# Altium project PGS-System.PrjPcb (part 1 of 16)
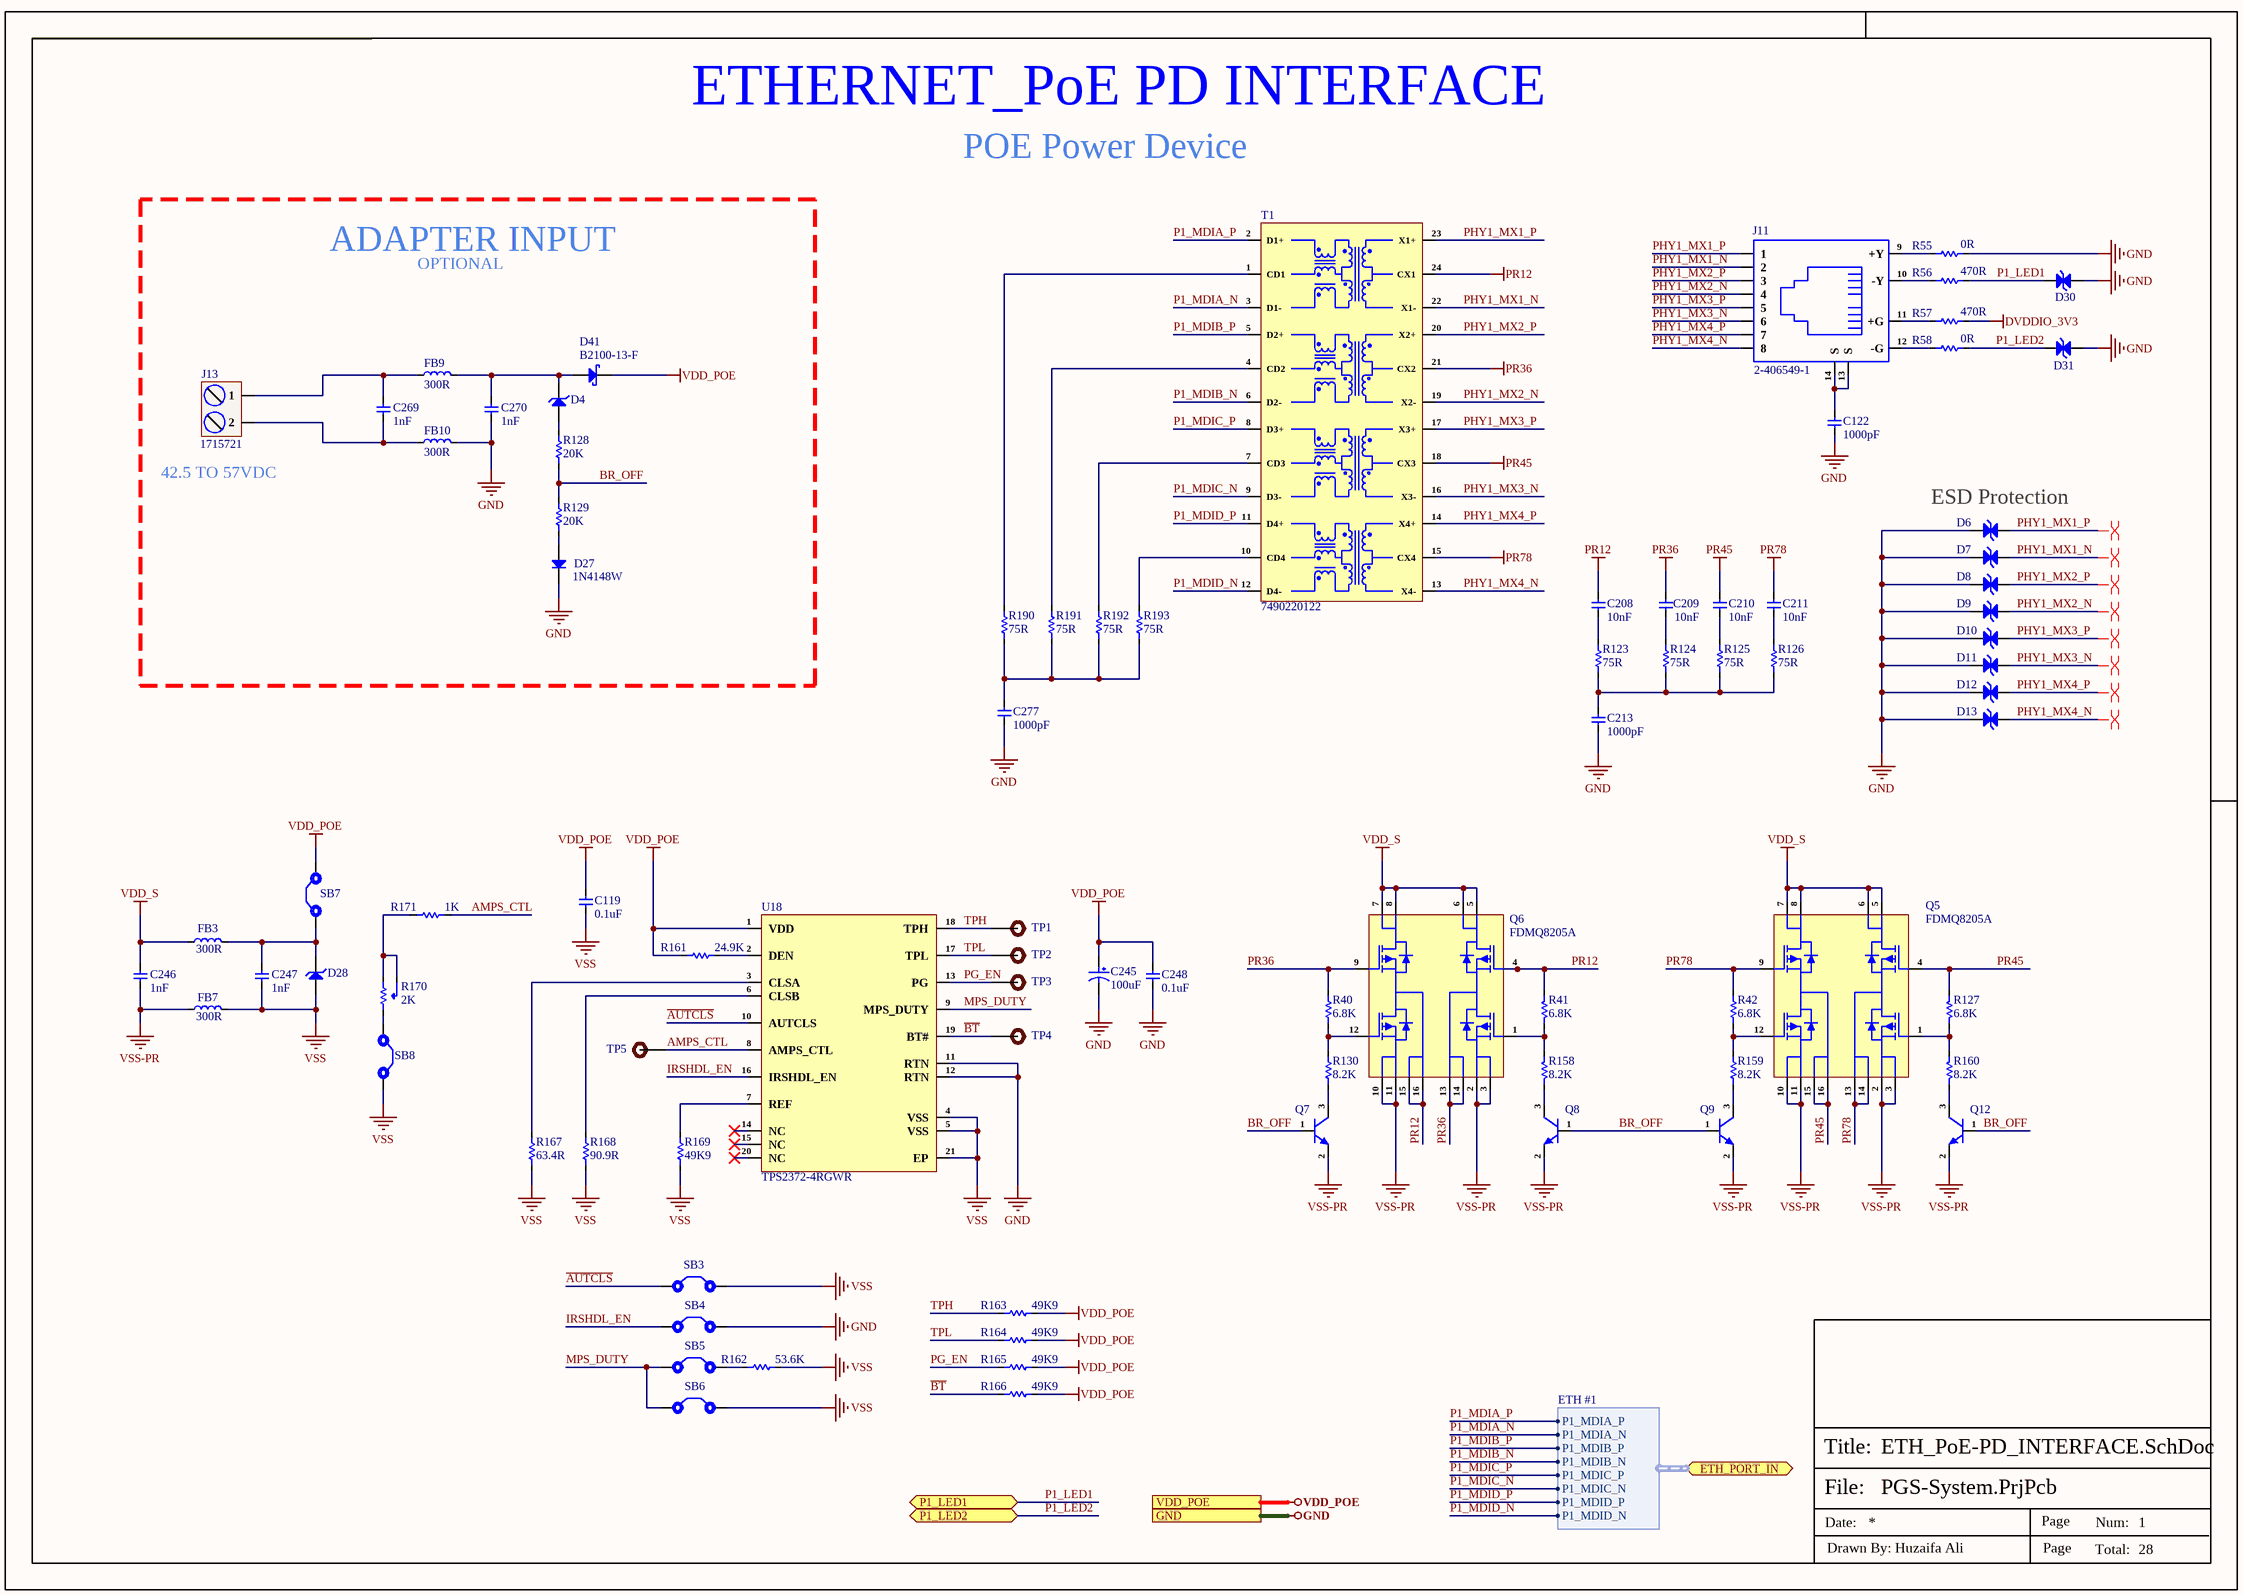
[diagram p0: ETH_PoE-PD_INTERFACE.SchDoc]
28 sheets, 630 parts. Net scope: flat (ports and power ports of the same name join across sheets).
Sheets:
  ETH_PoE-PD_INTERFACE.SchDoc
  PoE_PSE_CONTROLLER.SchDoc
  BUCK_CONVERTER_SHEET1.SchDoc
  BUCK_CONTROLLER_SHEET2.SchDoc
  POWER_LDO_SHEET.SchDoc
  POWER_PMIC_RK809_DC DC.SchDoc
  POWER_PMIC_RK809_LDO.SchDoc
  POWER_PMIC_RK809_MGM.SchDoc
  POWER_PMIC_RK809_CODEC.SchDoc
  RV1126_POWER_SHEET.SchDoc
  RV1126_DRAM_SHEET.SchDoc
  RV1126_SARADC_SHEET.SchDoc
  RV1126_AUDIO_SHEET.SchDoc
  RV1126_ETHERNET_SHEET.SchDoc
  RV1126_eMMC_SPI-FLASH.SchDoc
  RV1126_OSC-PLL-PMUIO.SchDoc
  RV1126_SDMMC_SHEET.SchDoc
  DDR3_SDRAM_SHEET.SchDoc
  eMMC_INTERFACE.SchDoc
  SPI_FLASH_INTERFACE.SchDoc
  ETH_SWITCH_INTERFACE.SchDoc
  MIPI-CSI_RXX_INTERFACE.SchDoc
  MIPI TO HDMI_MODULE.SchDoc
  DIGITAL_MEMS_INTERFACE.SchDoc
  SPEARKER_INTERFACE_SHEET.SchDoc
  IR-CUT_LIGHT SENSOR_SHEET.SchDoc
  USB2.0_DEBUG_UART.SchDoc
  DEBUG_UART_INTERFACE.SchDoc

## Sheet ETH_PoE-PD_INTERFACE.SchDoc
size 420 x 297 mm; SheetNumber: 1; SheetTotal: 28

### Parts
C119  0.1uF  [Cap-0603]
C122  1000pF  [Cap-1206]
C208  10nF  [Cap-0402]
C209  10nF  [Cap-0402]
C210  10nF  [Cap-0402]
C211  10nF  [Cap-0402]
C213  1000pF  [Cap-1206]
C245  100uF  [EEEFK2A101AM]
C246  1nF  [Cap-0603]
C247  1nF  [Cap-0603]
C248  0.1uF  [Cap-0603]
C269  1nF  [Cap-0603]
C270  1nF  [Cap-0603]
C277  1000pF  [Cap-1206]
D4  MMSZ5242BS-7-F  [SOD-323]  (value not drawn)
D6  ESD9X5VU  [DFN1006-2L_]  (value not drawn)
D7  ESD9X5VU  [DFN1006-2L_]  (value not drawn)
D8  ESD9X5VU  [DFN1006-2L_]  (value not drawn)
D9  ESD9X5VU  [DFN1006-2L_]  (value not drawn)
D10  ESD9X5VU  [DFN1006-2L_]  (value not drawn)
D11  ESD9X5VU  [DFN1006-2L_]  (value not drawn)
D12  ESD9X5VU  [DFN1006-2L_]  (value not drawn)
D13  ESD9X5VU  [DFN1006-2L_]  (value not drawn)
D27  1N4148W  [SOD-123]
D28  SMBJ58A-13-F  [SMB_]  (value not drawn)
D30  ESD9X5VU  [DFN1006-2L_]  (value not drawn)
D31  ESD9X5VU  [DFN1006-2L_]  (value not drawn)
D41  B2100-13-F  [SMB_]
FB3  300R  [IND-0603 (1608 Metric)]
FB7  300R  [IND-0603 (1608 Metric)]
FB9  300R  [IND-0603 (1608 Metric)]
FB10  300R  [IND-0603 (1608 Metric)]
J11  2-406549-1  [2-406549-1]
J13  1715721  [1715721]
Q5  FDMQ8205A  [12-MLP (5x4.5)]
Q6  FDMQ8205A  [12-MLP (5x4.5)]
Q7  MMBTA06-7-F  [SOT-23]  (value not drawn)
Q8  MMBTA06-7-F  [SOT-23]  (value not drawn)
Q9  MMBTA06-7-F  [SOT-23]  (value not drawn)
Q12  MMBTA06-7-F  [SOT-23]  (value not drawn)
R40  6.8K  [Res-0402]
R41  6.8K  [Res-0402]
R42  6.8K  [Res-0402]
R55  0R  [Res-0402]
R56  470R  [Res-0402]
R57  470R  [Res-0402]
R58  0R  [Res-0402]
R123  75R  [Res-0402]
R124  75R  [Res-0402]
R125  75R  [Res-0402]
R126  75R  [Res-0402]
R127  6.8K  [Res-0402]
R128  20K  [Res-0603]
R129  20K  [Res-0603]
R130  8.2K  [Res-0402]
R158  8.2K  [Res-0402]
R159  8.2K  [Res-0402]
R160  8.2K  [Res-0402]
R161  24.9K  [Res-0603]
R162  53.6K  [Res-0603]
R163  49K9  [Res-0603]
R164  49K9  [Res-0603]
R165  49K9  [Res-0603]
R166  49K9  [Res-0603]
R167  63.4R  [Res-0603]
R168  90.9R  [Res-0603]
R169  49K9  [Res-0603]
R170  2K  [3362P-1-202LF]
R171  1K  [Res-0603]
R190  75R  [Res-0402]
R191  75R  [Res-0402]
R192  75R  [Res-0402]
R193  75R  [Res-0402]
SB3  Solder Bridge 0402  [Solder Bridge 0402]  (value not drawn)  (no BOM)
SB4  Solder Bridge 0402  [Solder Bridge 0402]  (value not drawn)  (no BOM)
SB5  Solder Bridge 0402  [Solder Bridge 0402]  (value not drawn)  (no BOM)
SB6  Solder Bridge 0402  [Solder Bridge 0402]  (value not drawn)  (no BOM)
SB7  Solder Bridge_1206  [SOLDER BRIDGE-1206_]  (value not drawn)  (no BOM)
SB8  Solder Bridge_1206  [SOLDER BRIDGE-1206_]  (value not drawn)  (no BOM)
T1  7490220122  [7490220122]
TP1  TEST POINT 0.5mm Dia  [Test-point - 0.5mm]  (value not drawn)  (no BOM)
TP2  TEST POINT 0.5mm Dia  [Test-point - 0.5mm]  (value not drawn)  (no BOM)
TP3  TEST POINT 0.5mm Dia  [Test-point - 0.5mm]  (value not drawn)  (no BOM)
TP4  TEST POINT 0.5mm Dia  [Test-point - 0.5mm]  (value not drawn)  (no BOM)
TP5  TEST POINT 0.5mm Dia  [Test-point - 0.5mm]  (value not drawn)  (no BOM)
U18  TPS2372-4RGWR  [VQFN-20-EP(5x5)]

### Blocks framed on the sheet
ADAPTER INPUT: C269 C270 D4 D27 D41 FB9 FB10 J13 R128 R129

### Ports
ETH_PORT_IN (bidir, harness ETH #1, see ETH_SWITCH_INTERFACE[3D]), GND (see BUCK_CONTROLLER_SHEET2[3D], BUCK_CONVERTER_SHEET1[3D], DDR3_SDRAM_SHEET[5D], DEBUG_UART_INTERFACE[3D], DIGITAL_MEMS_INTERFACE[3C], eMMC_INTERFACE[3D], ETH_SWITCH_INTERFACE[5D], IR-CUT_LIGHT SENSOR_SHEET[3D], MIPI TO HDMI_MODULE[3D], MIPI-CSI_RXX_INTERFACE[3C], PoE_PSE_CONTROLLER[5D], POWER_LDO_SHEET[3D], POWER_PMIC_RK809_CODEC[3C], POWER_PMIC_RK809_DC DC[3D], POWER_PMIC_RK809_LDO[4C], POWER_PMIC_RK809_MGM[3D], RV1126_AUDIO_SHEET[3D], RV1126_DRAM_SHEET[4C], RV1126_eMMC_SPI-FLASH[3C], RV1126_ETHERNET_SHEET[3D], RV1126_OSC-PLL-PMUIO[3C], RV1126_POWER_SHEET[1D], RV1126_SARADC_SHEET[3C], RV1126_SDMMC_SHEET[3C], SPEARKER_INTERFACE_SHEET[3C], SPI_FLASH_INTERFACE[3D], USB2.0_DEBUG_UART[3D]), P1_LED1 (bidir, see ETH_SWITCH_INTERFACE[5C]), P1_LED2 (bidir, see ETH_SWITCH_INTERFACE[5C]), VDD_POE (see BUCK_CONTROLLER_SHEET2[3D], BUCK_CONVERTER_SHEET1[3D], PoE_PSE_CONTROLLER[5D])

### Harnesses
ETH #1: P1_MDIA_P, P1_MDIA_N, P1_MDIB_P, P1_MDIB_N, P1_MDIC_P, P1_MDIC_N, P1_MDID_P, P1_MDID_N

### Nets
DVDDIO_3V3: R57.2
GND: C122.1 C213.1 C245.2 C248.1 C270.1 C277.1 D6.1(A) D7.1(A) D8.1(A) D9.1(A) D10.1(A) D11.1(A) D12.1(A) D13.1(A) D27.2(K) D30.1(A) D31.1(A) FB10.2 R55.2 SB4.2 U18.11(RTN) U18.12(RTN) ; port GND  [project net KSENSD]
PR12: C208.2 Q6.4(G2) Q6.15(INPUT2) Q6.16(INPUT2) R41.1 T1.24(CX1)
PR36: C209.2 Q6.9(G3) Q6.13(INPUT1) Q6.14(INPUT1) R40.1 T1.21(CX2)
PR45: C210.2 Q5.4(G2) Q5.15(INPUT2) Q5.16(INPUT2) R127.1 T1.18(CX3)
PR78: C211.2 Q5.9(G3) Q5.13(INPUT1) Q5.14(INPUT1) R42.1 T1.15(CX4)
VDD_POE: C119.2 C245.1 C248.2 D41.2(K) R161.1 R163.1 R164.1 R165.1 R166.1 SB7.2 U18.1(VDD) ; port VDD_POE
VDD_S: C246.2 FB3.1 Q5.5(OUTP) Q5.6(OUTP) Q5.7(OUTP) Q5.8(OUTP) Q6.5(OUTP) Q6.6(OUTP) Q6.7(OUTP) Q6.8(OUTP)
VSS: C119.1 C247.1 D28.1(A) FB7.2 R162.2 R167.1 R168.1 R169.1 SB3.2 SB6.2 SB8.2 U18.4(VSS) U18.5(VSS) U18.21(EP)
VSS-PR: C246.1 FB7.1 Q5.2(OUTN) Q5.3(OUTN) Q5.10(OUTN) Q5.11(OUTN) Q6.2(OUTN) Q6.3(OUTN) Q6.10(OUTN) Q6.11(OUTN) Q7.2(E) Q8.2(E) Q9.2(E) Q12.2(E)
~{AUTCLS}: SB3.1 U18.10(AUTCLS)
AMPS_CTL: R171.1 TP5.1 U18.8(AMPS_CTL)
~{BT}: R166.2 TP4.1 U18.19(BT#)
BR_OFF: Q7.1(B) Q8.1(B) Q9.1(B) Q12.1(B) R128.1 R129.2
IRSHDL_EN: SB4.1 U18.16(IRSHDL_EN)
MPS_DUTY: SB5.1 SB6.1 U18.9(MPS_DUTY)
P1_LED1: D30.2(A) R56.2 ; port P1_LED1
P1_LED2: D31.2(A) R58.2 ; port P1_LED2
P1_MDIA_N: T1.3(D1-) ; port ETH_PORT_IN.P1_MDIA_N
P1_MDIA_P: T1.2(D1+) ; port ETH_PORT_IN.P1_MDIA_P
P1_MDIB_N: T1.6(D2-) ; port ETH_PORT_IN.P1_MDIB_N
P1_MDIB_P: T1.5(D2+) ; port ETH_PORT_IN.P1_MDIB_P
P1_MDIC_N: T1.9(D3-) ; port ETH_PORT_IN.P1_MDIC_N
P1_MDIC_P: T1.8(D3+) ; port ETH_PORT_IN.P1_MDIC_P
P1_MDID_N: T1.12(D4-) ; port ETH_PORT_IN.P1_MDID_N
P1_MDID_P: T1.11(D4+) ; port ETH_PORT_IN.P1_MDID_P
PG_EN: R165.2 TP3.1 U18.13(PG)
PHY1_MX1_N: D7.2(A) J11.2 T1.22(X1-)
PHY1_MX1_P: D6.2(A) J11.1 T1.23(X1+)
PHY1_MX2_N: D9.2(A) J11.4 T1.19(X2-)
PHY1_MX2_P: D8.2(A) J11.3 T1.20(X2+)
PHY1_MX3_N: D11.2(A) J11.6 T1.16(X3-)
PHY1_MX3_P: D10.2(A) J11.5 T1.17(X3+)
PHY1_MX4_N: D13.2(A) J11.8 T1.13(X4-)
PHY1_MX4_P: D12.2(A) J11.7 T1.14(X4+)
TPH: R163.2 TP1.1 U18.18(TPH)
TPL: R164.2 TP2.1 U18.17(TPL)
NetC122_2: C122.2 J11.13(S) J11.14(S)
NetC208_1: C208.1 R123.2
NetC209_1: C209.1 R124.2
NetC210_1: C210.1 R125.2
NetC211_1: C211.1 R126.2
NetC213_2: C213.2 R123.1 R124.1 R125.1 R126.1
NetC247_2: C247.2 D28.2(K) FB3.2 SB7.1
NetC269_1: C269.1 FB10.1 J13.2
NetC269_2: C269.2 FB9.1 J13.1
NetC270_2: C270.2 D4.1(K) D41.1(A) FB9.2
NetC277_2: C277.2 R190.1 R191.1 R192.1 R193.1
NetD4_2: D4.2(A) R128.2
NetD27_1: D27.1(A) R129.1
NetJ11_9: J11.9(+Y) R55.1
NetJ11_10: J11.10(-Y) R56.1
NetJ11_11: J11.11(+G) R57.1
NetJ11_12: J11.12(-G) R58.1
NetQ5_1: Q5.1(G1) R127.2 R160.2
NetQ5_12: Q5.12(G4) R42.2 R159.2
NetQ6_1: Q6.1(G1) R41.2 R158.2
NetQ6_12: Q6.12(G4) R40.2 R130.2
NetQ7_3: Q7.3(C) R130.1
NetQ8_3: Q8.3(C) R158.1
NetQ9_3: Q9.3(C) R159.1
NetQ12_3: Q12.3(C) R160.1
NetR161_2: R161.2 U18.2(DEN)
NetR162_1: R162.1 SB5.2
NetR167_2: R167.2 U18.3(CLSA)
NetR168_2: R168.2 U18.6(CLSB)
NetR169_2: R169.2 U18.7(REF)
NetR170_1: R170.1(CCW) R170.2(Wiper) R171.2
NetR170_3: R170.3(CW) SB8.1
NetR190_2: R190.2 T1.1(CD1)
NetR191_2: R191.2 T1.4(CD2)
NetR192_2: R192.2 T1.7(CD3)
NetR193_2: R193.2 T1.10(CD4)

Not connected (* = marked no-connect by the designer): U18 14(NC)* 15(NC)* 20(NC)*

### Layout directives
differential pair; differential pair class DIFF-ETH-100; rule Impedance Constraint [Min = 100.0    Max = 110.0    ]; rule Matched Net Lengths [Tolerance = 0.508mm]: PHY1_MX1_N, PHY1_MX1_P, PHY1_MX2_N, PHY1_MX2_P, PHY1_MX3_N, PHY1_MX3_P, PHY1_MX4_N, PHY1_MX4_P

### Notes on the sheet
- ETHERNET_PoE PD INTERFACE
- POE Power Device
- OPTIONAL
- (near J13) 42.5 TO 57VDC
- (near D6) ESD Protection
- File:
- Title:
- Date:
- Page
- Num:
- Total:
- Drawn By: Huzaifa Ali